# Altium schematic sheet microcontroller.SchDoc
size Legal; SheetNumber: 2; SheetTotal: 2
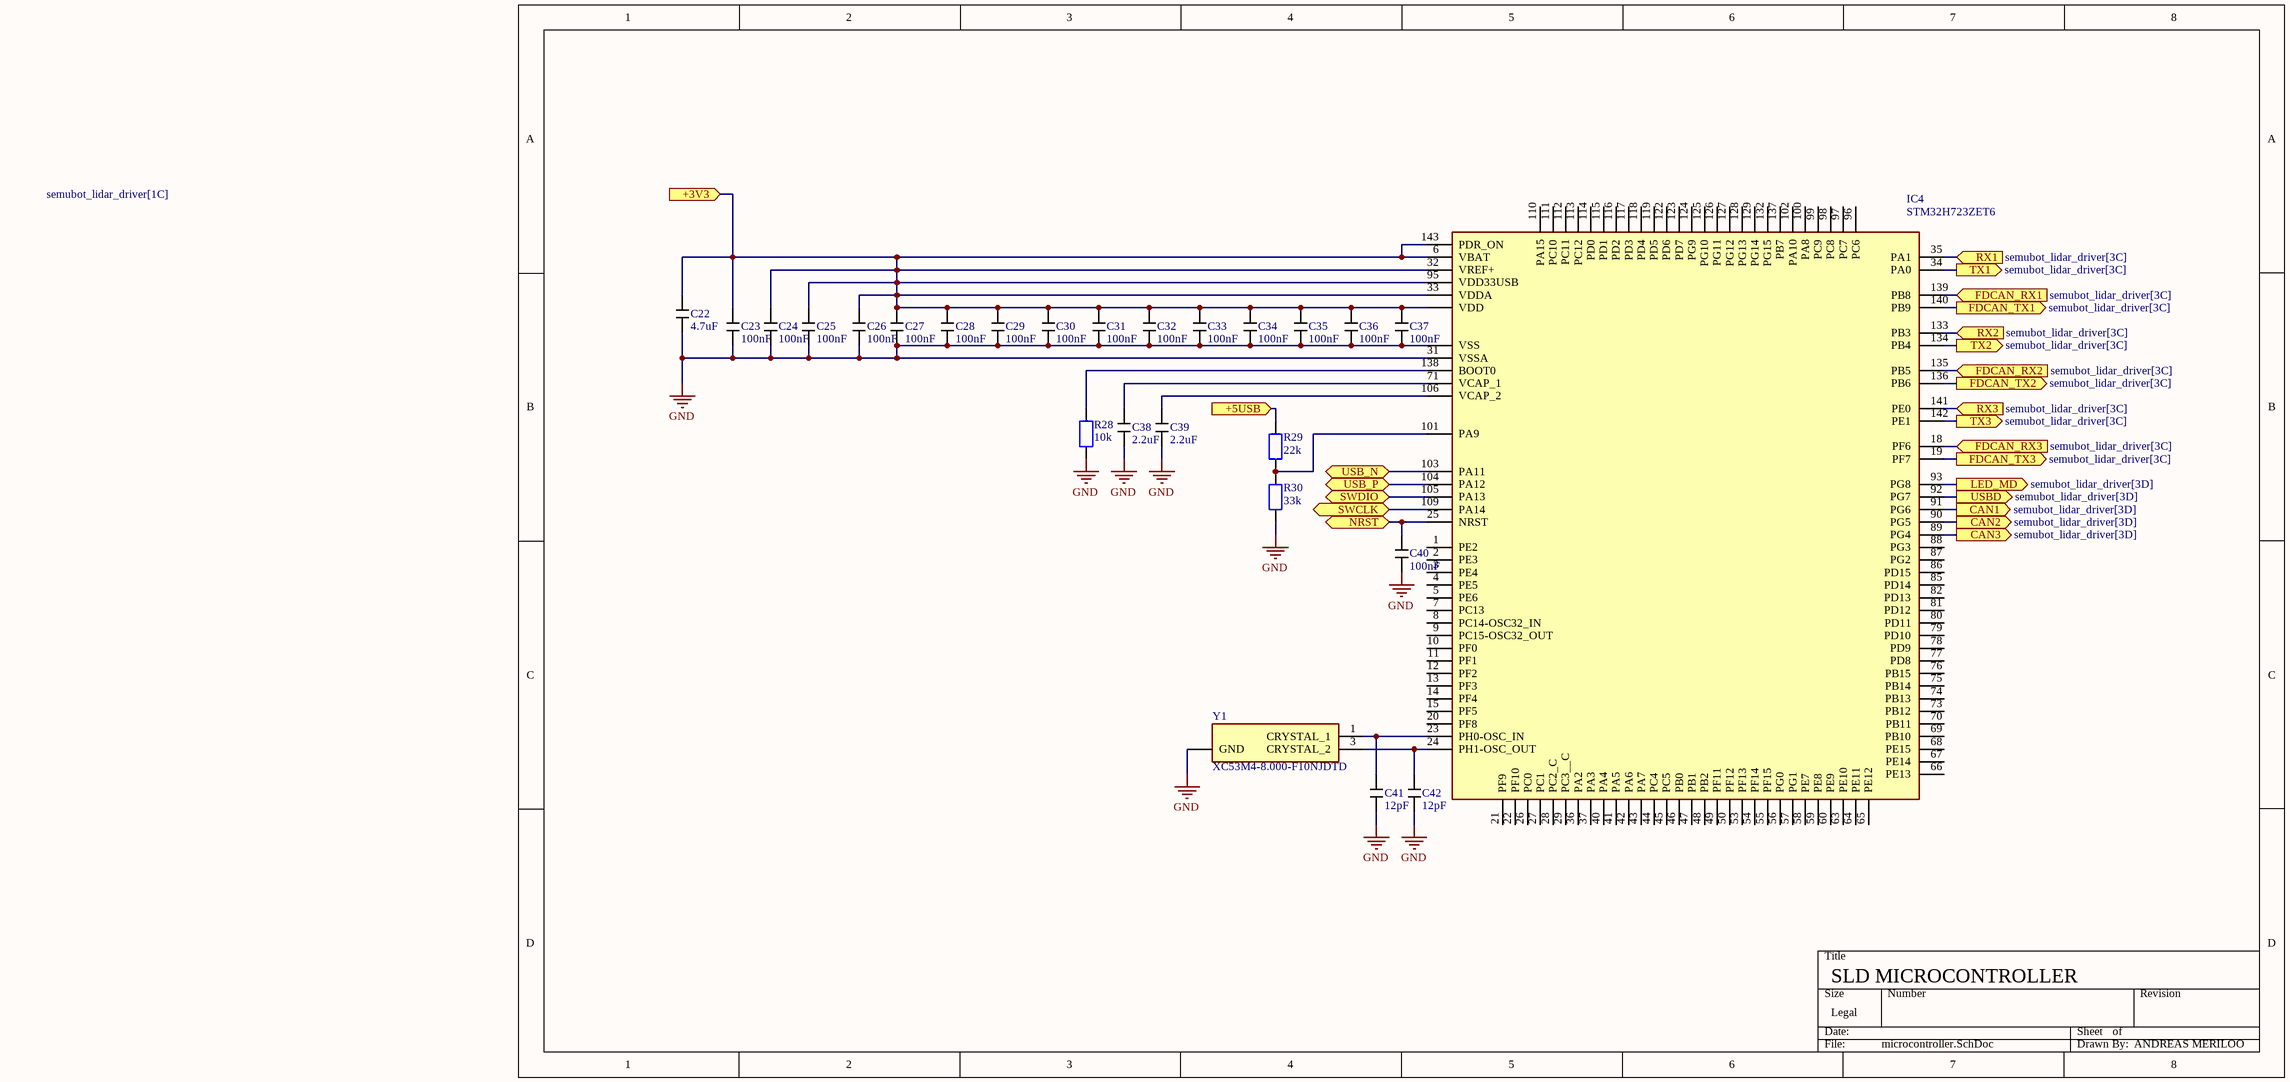
[diagram p0: microcontroller.SchDoc]

## Parts
C22  4.7uF  [0805Capacitor]
C23  100nF  [0603Capacitor]
C24  100nF  [0603Capacitor]
C25  100nF  [0603Capacitor]
C26  100nF  [0603Capacitor]
C27  100nF  [0603Capacitor]
C28  100nF  [0603Capacitor]
C29  100nF  [0603Capacitor]
C30  100nF  [0603Capacitor]
C31  100nF  [0603Capacitor]
C32  100nF  [0603Capacitor]
C33  100nF  [0603Capacitor]
C34  100nF  [0603Capacitor]
C35  100nF  [0603Capacitor]
C36  100nF  [0603Capacitor]
C37  100nF  [0603Capacitor]
C38  2.2uF  [1206CAPACITOR]
C39  2.2uF  [1206CAPACITOR]
C40  100nF  [0603Capacitor]
C41  12pF  [0603Capacitor]
C42  12pF  [0603Capacitor]
IC4  STM32H723ZET6  [STM32H723ZET6]
R28  10k  [0603Resistor]
R29  22k  [0603Resistor]
R30  33k  [0603Resistor]
Y1  XC53M4-8.000-F10NJDTD  [XC53M48000F10NJDTD]

## Ports
+3V3 (in, see semubot_lidar_driver[1C]), +5USB (in, see semubot_lidar_driver[1C]), CAN1 (out, see semubot_lidar_driver[3D]), CAN2 (out, see semubot_lidar_driver[3D]), CAN3 (out, see semubot_lidar_driver[3D]), FDCAN_RX1 (in, see semubot_lidar_driver[3C]), FDCAN_RX2 (in, see semubot_lidar_driver[3C]), FDCAN_RX3 (in, see semubot_lidar_driver[3C]), FDCAN_TX1 (out, see semubot_lidar_driver[3C]), FDCAN_TX2 (out, see semubot_lidar_driver[3C]), FDCAN_TX3 (out, see semubot_lidar_driver[3C]), LED_MD (out, see semubot_lidar_driver[3D]), NRST (bidir, see semubot_lidar_driver[1C]), RX1 (in, see semubot_lidar_driver[3C]), RX2 (in, see semubot_lidar_driver[3C]), RX3 (in, see semubot_lidar_driver[3C]), SWCLK (bidir, see semubot_lidar_driver[1C]), SWDIO (bidir, see semubot_lidar_driver[1C]), TX1 (out, see semubot_lidar_driver[3C]), TX2 (out, see semubot_lidar_driver[3C]), TX3 (out, see semubot_lidar_driver[3C]), USB_N (bidir, see semubot_lidar_driver[1C]), USB_P (bidir, see semubot_lidar_driver[1C]), USBD (out, see semubot_lidar_driver[3D])

## Nets
GND: C22.1 C23.1 C24.1 C25.1 C26.1 C27.1 C28.1 C29.1 C30.1 C31.1 C32.1 C33.1 C34.1 C35.1 C36.1 C37.1 C38.1 C39.1 C40.1 C41.1 C42.1 IC4.16(VSS) IC4.31(VSSA) R28.1 R30.1 Y1.4(GND)
+3V3: C22.2 C23.2 C24.2 C25.2 C26.2 C27.2 C28.2 C29.2 C30.2 C31.2 C32.2 C33.2 C34.2 C35.2 C36.2 C37.2 IC4.6(VBAT) IC4.17(VDD) IC4.32(VREF+) IC4.33(VDDA) IC4.95(VDD33USB) IC4.143(PDR_ON) ; port +3V3
+5USB: R29.1 ; port +5USB
CAN1: IC4.91(PG6) ; port CAN1
CAN2: IC4.90(PG5) ; port CAN2
CAN3: IC4.89(PG4) ; port CAN3
FDCAN_RX1: IC4.139(PB8) ; port FDCAN_RX1
FDCAN_RX2: IC4.135(PB5) ; port FDCAN_RX2
FDCAN_RX3: IC4.18(PF6) ; port FDCAN_RX3
FDCAN_TX1: IC4.140(PB9) ; port FDCAN_TX1
FDCAN_TX2: IC4.136(PB6) ; port FDCAN_TX2
FDCAN_TX3: IC4.19(PF7) ; port FDCAN_TX3
LED_MD: IC4.93(PG8) ; port LED_MD
NRST: C40.2 IC4.25(NRST) ; port NRST
RX1: IC4.35(PA1) ; port RX1
RX2: IC4.133(PB3) ; port RX2
RX3: IC4.141(PE0) ; port RX3
SWCLK: IC4.109(PA14) ; port SWCLK
SWDIO: IC4.105(PA13) ; port SWDIO
TX1: IC4.34(PA0) ; port TX1
TX2: IC4.134(PB4) ; port TX2
TX3: IC4.142(PE1) ; port TX3
USB_N: IC4.103(PA11) ; port USB_N
USB_P: IC4.104(PA12) ; port USB_P
USBD: IC4.92(PG7) ; port USBD
NetC38_2: C38.2 IC4.71(VCAP_1)
NetC39_2: C39.2 IC4.106(VCAP_2)
NetC41_2: C41.2 IC4.23(PH0-OSC_IN) Y1.1(CRYSTAL_1)
NetC42_2: C42.2 IC4.24(PH1-OSC_OUT) Y1.3(CRYSTAL_2)
NetIC4_101: IC4.101(PA9) R29.2 R30.2
NetIC4_138: IC4.138(BOOT0) R28.2

Not connected (* = marked no-connect by the designer): IC4 1(PE2) 2(PE3) 3(PE4) 4(PE5) 5(PE6) 7(PC13) 8(PC14-OSC32_IN) 9(PC15-OSC32_OUT) 10(PF0) 11(PF1) 12(PF2) 13(PF3) 14(PF4) 15(PF5) 20(PF8) 21(PF9) 22(PF10) 26(PC0) 27(PC1) 28(PC2_C) 29(PC3__C) 36(PA2) 37(PA3) 40(PA4) 41(PA5) 42(PA6) 43(PA7) 44(PC4) 45(PC5) 46(PB0) 47(PB1) 48(PB2) 49(PF11) 50(PF12) 53(PF13) 54(PF14) 55(PF15) 56(PG0) 57(PG1) 58(PE7) 59(PE8) 60(PE9) 63(PE10) 64(PE11) 65(PE12) 66(PE13) 67(PE14) 68(PE15) 69(PB10) 70(PB11) 73(PB12) 74(PB13) 75(PB14) 76(PB15) 77(PD8) 78(PD9) 79(PD10) 80(PD11) 81(PD12) 82(PD13) 85(PD14) 86(PD15) 87(PG2) 88(PG3) 96(PC6) 97(PC7) 98(PC8) 99(PC9) 100(PA8) 102(PA10) 110(PA15) 111(PC10) 112(PC11) 113(PC12) 114(PD0) 115(PD1) 116(PD2) 117(PD3) 118(PD4) 119(PD5) 122(PD6) 123(PD7) 124(PG9) 125(PG10) 126(PG11) 127(PG12) 128(PG13) 129(PG14) 132(PG15) 137(PB7)

## Notes on the sheet
- SLD MICROCONTROLLER
- ANDREAS MERILOO

## Library data of the parts
C22-C42 = Capacitor
  C22: Capacitance: 4.7uF
  C23-C37 C40: Capacitance: 100nF
  C38 C39: Capacitance: 2.2uF
  C41 C42: Capacitance: 12pF
IC4 = STM32H723ZET6: Integrated Circuit; pin to pad: 16>16+38+51+61+83+94+107+120+130 17>17+30+39+52+62+72+84+108+121+131+144; Manufacturer_Name: STMicroelectronics; Datasheet Link: https://www.st.com/resource/en/datasheet/stm32h723zg.pdf; Height: 1.6mm; Manufacturer_Part_Number: STM32H723ZET6; Mouser Part Number: 511-STM32H723ZET6; Mouser Price/Stock: https://www.mouser.co.uk/ProductDetail/STMicroelectronics/STM32H723ZET6?qs=sPbYRqrBIVnvdSB0MwAafg%3D%3D; Arrow Part Number: STM32H723ZET6; Arrow Price/Stock: https://www.arrow.com/en/products/stm32h723zet6/stmicroelectronics?utm_currency=USD&region=nac
R28-R30 = Resistor: SMD Resistor
  R28: Resistance: 10k
  R29: Resistance: 22k
  R30: Resistance: 33k
Y1 = XC53M4-8.000-F10NJDTD: Crystal or Oscillator; pin to pad: 4>4+2; Manufacturer_Name: Hang Crystal International; Datasheet Link: https://atlas.eefcdn.com/partdatasheet/666696/666696_94707471_1757293827116.pdf; Height: 0.8mm; Manufacturer_Part_Number: XC53M4-8.000-F10NJDTD